# Altium schematic sheet SiPAP_Main_RevC.SchDoc
size 457 x 419 mm; SheetNumber: 1; SheetTotal: 1
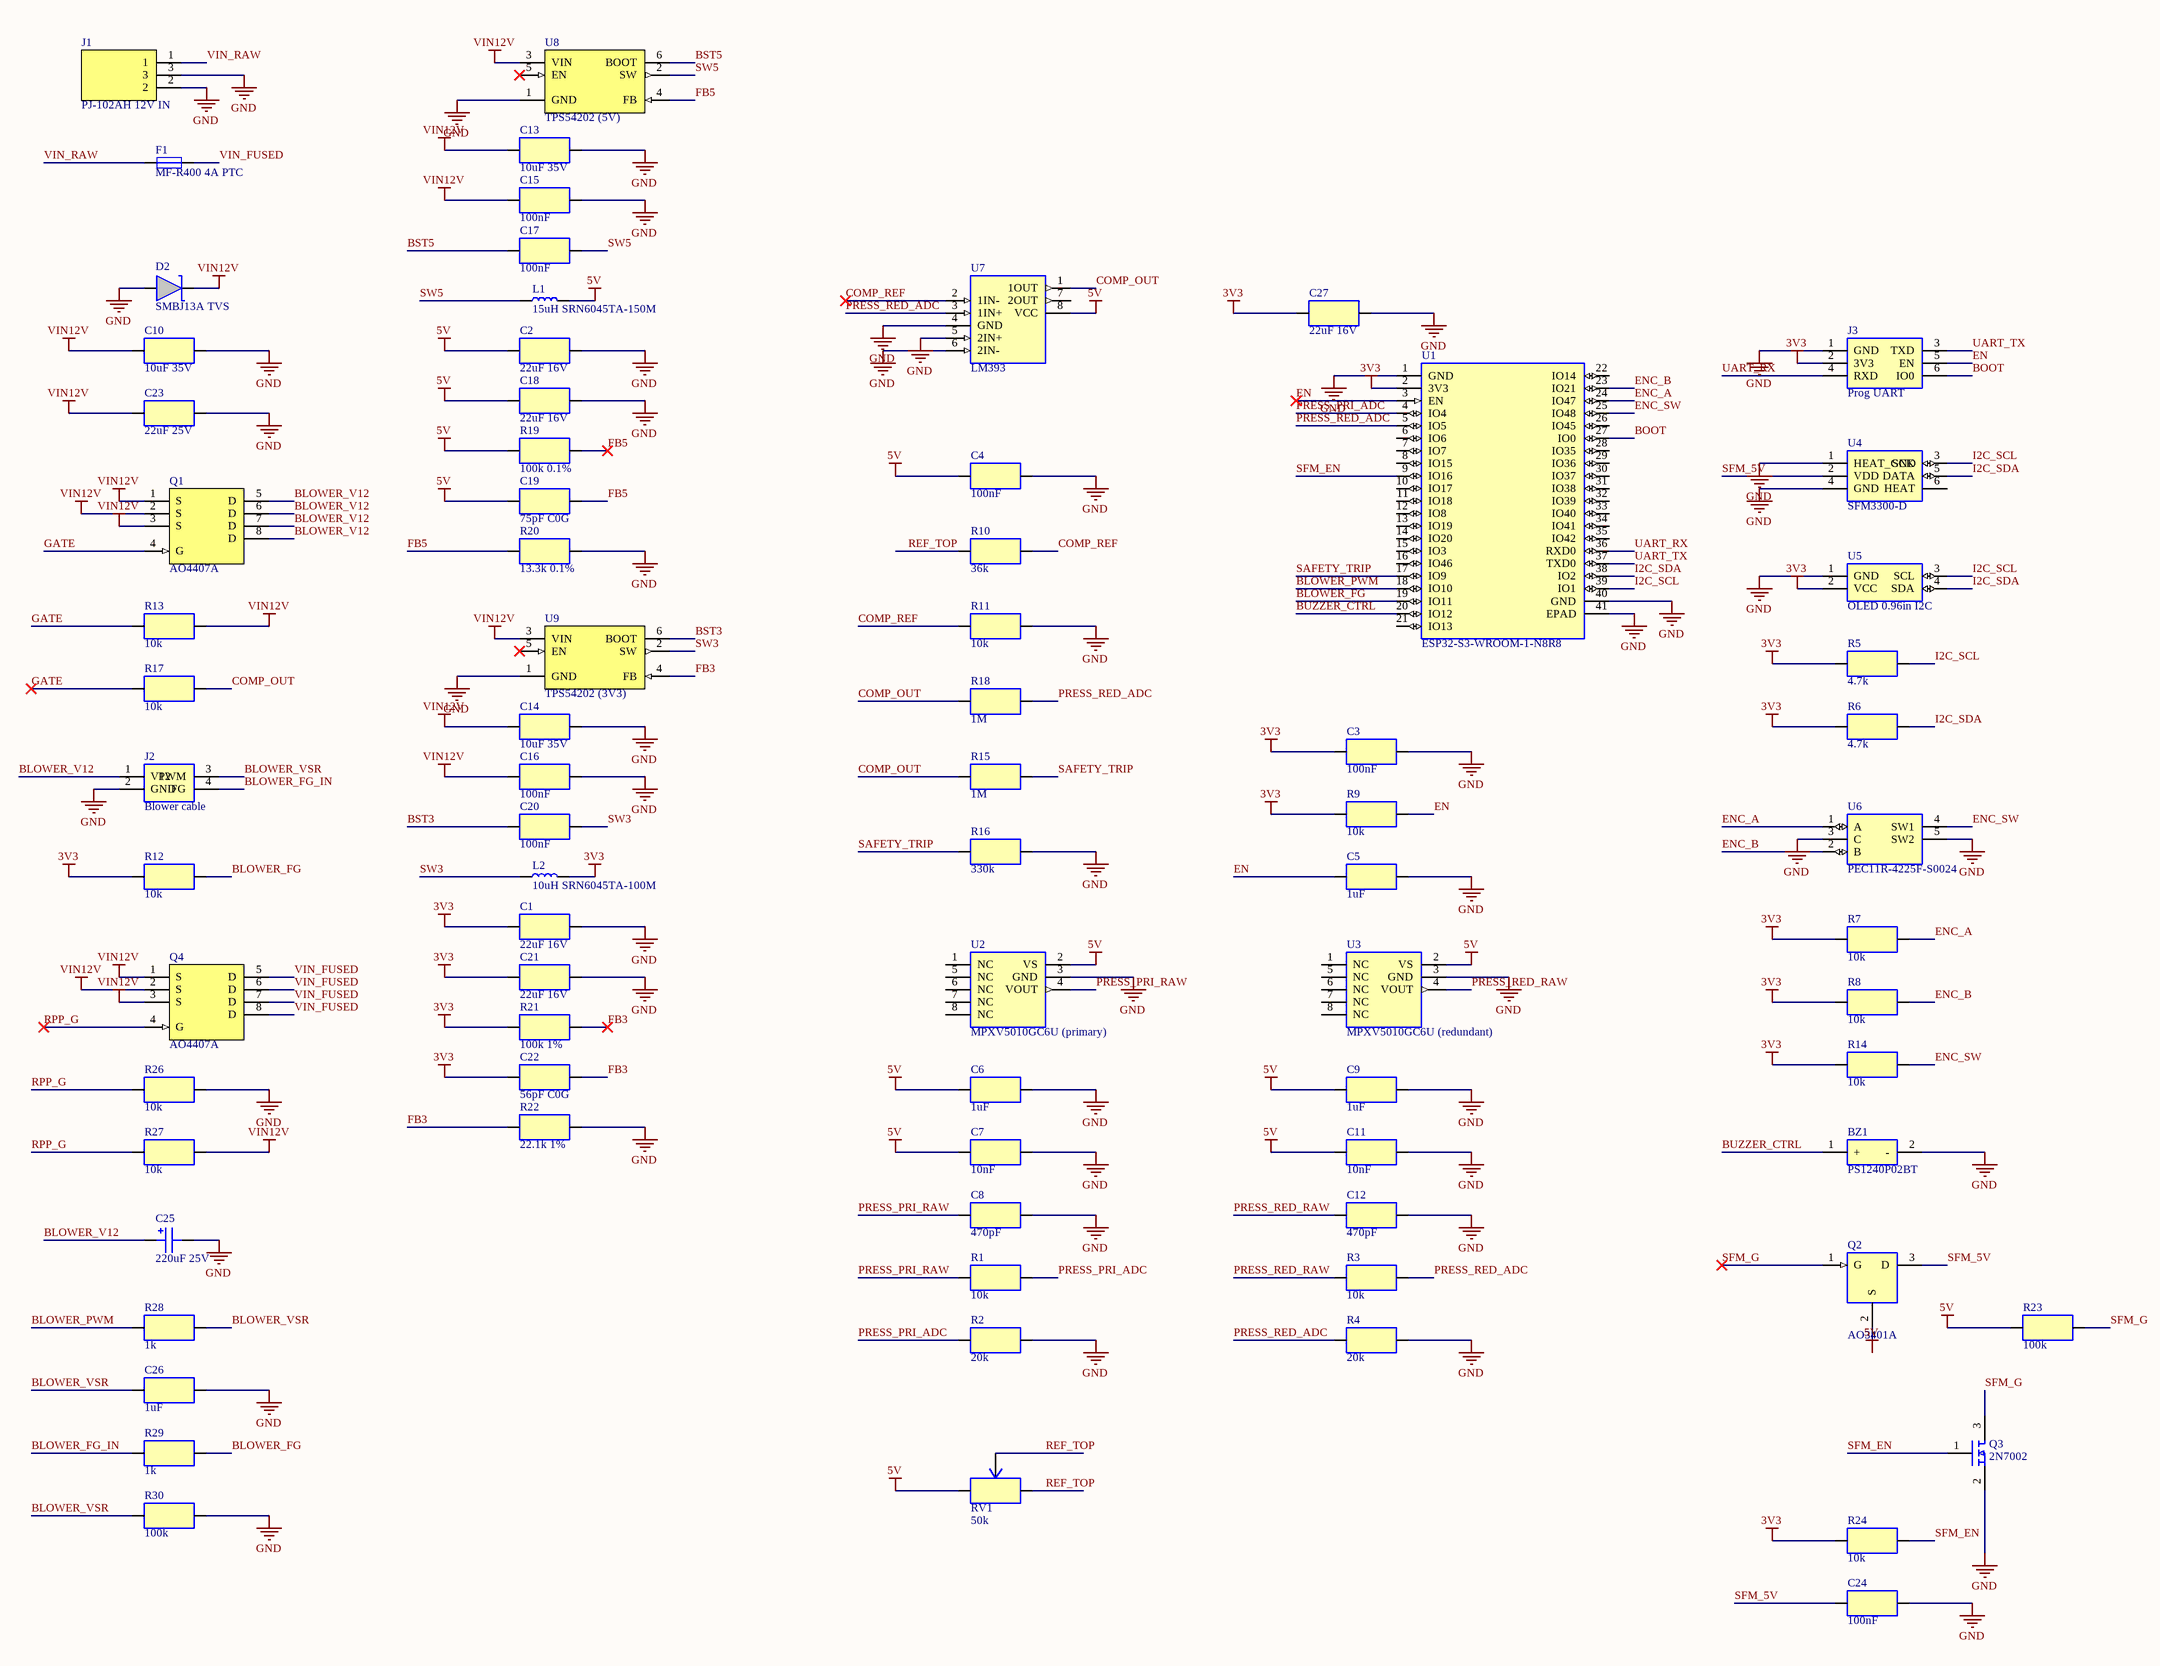
[diagram p0: SiPAP_Main_RevC.SchDoc]

## Parts
BZ1  PS1240P02BT  [BUZZER_TDK_PS1240]
C1  22uF 16V  [R_0805]
C2  22uF 16V  [R_0805]
C3  100nF  [R_0805]
C4  100nF  [R_0805]
C5  1uF  [R_0805]
C6  1uF  [R_0805]
C7  10nF  [R_0805]
C8  470pF  [R_0805]
C9  1uF  [R_0805]
C10  10uF 35V  [R_0805]
C11  10nF  [R_0805]
C12  470pF  [R_0805]
C13  10uF 35V  [R_0805]
C14  10uF 35V  [R_0805]
C15  100nF  [R_0805]
C16  100nF  [R_0805]
C17  100nF  [R_0805]
C18  22uF 16V  [R_0805]
C19  75pF C0G  [R_0805]
C20  100nF  [R_0805]
C21  22uF 16V  [R_0805]
C22  56pF C0G  [R_0805]
C23  22uF 25V  [R_0805]
C24  100nF  [R_0805]
C25  220uF 25V  [CAP_RAD_D8_P3.5]
C26  1uF  [R_0805]
C27  22uF 16V  [R_0805]
D2  SMBJ13A TVS  [DIOM_SMB_DO-214AA_BOURNS]
F1  MF-R400 4A PTC  [PTC_RADIAL_MF-R300]
J1  PJ-102AH 12V IN  [CUI_PJ-102AH]
J2  Blower cable  [CONN_HEADER_4_2X2]
J3  Prog UART  [CONN_HEADER_6]
L1  15uH SRN6045TA-150M  [IND_BOURNS_SRN6045TA]
L2  10uH SRN6045TA-100M  [IND_BOURNS_SRN6045TA]
Q1  AO4407A  [SOIC-8]
Q2  AO3401A  [SOT-23]
Q3  2N7002  [SOT-23]
Q4  AO4407A  [SOIC-8]
R1  10k  [R_0805]
R2  20k  [R_0805]
R3  10k  [R_0805]
R4  20k  [R_0805]
R5  4.7k  [R_0805]
R6  4.7k  [R_0805]
R7  10k  [R_0805]
R8  10k  [R_0805]
R9  10k  [R_0805]
R10  36k  [R_0805]
R11  10k  [R_0805]
R12  10k  [R_0805]
R13  10k  [R_0805]
R14  10k  [R_0805]
R15  1M  [R_0805]
R16  330k  [R_0805]
R17  10k  [R_0805]
R18  1M  [R_0805]
R19  100k 0.1%  [R_0805]
R20  13.3k 0.1%  [R_0805]
R21  100k 1%  [R_0805]
R22  22.1k 1%  [R_0805]
R23  100k  [R_0805]
R24  10k  [R_0805]
R26  10k  [R_0805]
R27  10k  [R_0805]
R28  1k  [R_0805]
R29  1k  [R_0805]
R30  100k  [R_0805]
RV1  50k  [BOURNS_3224W]
U1  ESP32-S3-WROOM-1-N8R8  [ESP32-S3-WROOM-1_DS]
U2  MPXV5010GC6U (primary)  [MPXV5010GC6U_482A]
U3  MPXV5010GC6U (redundant)  [MPXV5010GC6U_482A]
U4  SFM3300-D  [CONN_HEADER_6]
U5  OLED 0.96in I2C  [CONN_HEADER_4]
U6  PEC11R-4225F-S0024  [PEC11R-4xxxF-S_DS]
U7  LM393  [SOIC-8]
U8  TPS54202 (5V)  [TI_DDC0006A_SOT23-6]
U9  TPS54202 (3V3)  [TI_DDC0006A_SOT23-6]

## Nets
3V3: C1.1 C3.1 C21.1 C22.1 C27.1 J3.2(3V3) L2.2 R5.1 R6.1 R7.1 R8.1 R9.1 R12.1 R14.1 R21.1 R24.1 U1.2(3V3) U5.2(VCC)
5V: C2.1 C4.1 C6.1 C7.1 C9.1 C11.1 C18.1 C19.1 L1.2 Q2.2(S) R19.1 R23.1 RV1.1(CCW) U2.2(VS) U3.2(VS) U7.8(VCC)
GND: BZ1.2(-) C1.2 C2.2 C3.2 C4.2 C5.2 C6.2 C7.2 C8.2 C9.2 C10.2 C11.2 C12.2 C13.2 C14.2 C15.2 C16.2 C18.2 C21.2 C23.2 C24.2 C25.2 C26.2 C27.2 D2.2(A) J1.2 J1.3 J2.2(GND) J3.1(GND) Q3.2(S) R2.2 R4.2 R11.2 R16.2 R20.2 R22.2 R26.2 R30.2 U1.1(GND) U1.40(GND) U1.41(EPAD) U2.3(GND) U3.3(GND) U4.1(HEAT_GND) U4.4(GND) U5.1(GND) U6.3(C) U6.5(SW2) U7.4(GND) U7.5(2IN+) U7.6(2IN-) U8.1(GND) U9.1(GND)
VIN12V: C10.1 C13.1 C14.1 C15.1 C16.1 C23.1 D2.1(K) Q1.1(S) Q1.2(S) Q1.3(S) Q4.1(S) Q4.2(S) Q4.3(S) R13.2 R27.2 U8.3(VIN) U9.3(VIN)
BLOWER_FG: R12.2 R29.2 U1.19(IO11)
BLOWER_FG_IN: J2.4(FG) R29.1
BLOWER_PWM: R28.1 U1.18(IO10)
BLOWER_V12: C25.1 J2.1(V12) Q1.5(D) Q1.6(D) Q1.7(D) Q1.8(D)
BLOWER_VSR: C26.1 J2.3(PWM) R28.2 R30.1
BOOT: J3.6(IO0) U1.27(IO0)
BST3: C20.1 U9.6(BOOT)
BST5: C17.1 U8.6(BOOT)
BUZZER_CTRL: BZ1.1(+) U1.20(IO12)
COMP_OUT: R15.1 R17.2 R18.1 U7.1(1OUT)
COMP_REF: R10.2 R11.1 U7.2(1IN-)
EN: C5.1 J3.5(EN) R9.2 U1.3(EN)
ENC_A: R7.2 U1.24(IO47) U6.1(A)
ENC_B: R8.2 U1.23(IO21) U6.2(B)
ENC_SW: R14.2 U1.25(IO48) U6.4(SW1)
FB3: C22.2 R21.2 R22.1 U9.4(FB)
FB5: C19.2 R19.2 R20.1 U8.4(FB)
GATE: Q1.4(G) R13.1 R17.1
I2C_SCL: R5.2 U1.39(IO1) U4.3(SCK) U5.3(SCL)
I2C_SDA: R6.2 U1.38(IO2) U4.5(DATA) U5.4(SDA)
PRESS_PRI_ADC: R1.2 R2.1 U1.4(IO4)
PRESS_PRI_RAW: C8.1 R1.1 U2.4(VOUT)
PRESS_RED_ADC: R3.2 R4.1 R18.2 U1.5(IO5) U7.3(1IN+)
PRESS_RED_RAW: C12.1 R3.1 U3.4(VOUT)
REF_TOP: R10.1 RV1.2(W) RV1.3(CW)
RPP_G: Q4.4(G) R26.1 R27.1
SAFETY_TRIP: R15.2 R16.1 U1.17(IO9)
SFM_5V: C24.1 Q2.3(D) U4.2(VDD)
SFM_EN: Q3.1(G) R24.2 U1.9(IO16)
SFM_G: Q2.1(G) Q3.3(D) R23.2
SW3: C20.2 L2.1 U9.2(SW)
SW5: C17.2 L1.1 U8.2(SW)
UART_RX: J3.4(RXD) U1.36(RXD0)
UART_TX: J3.3(TXD) U1.37(TXD0)
VIN_FUSED: F1.2 Q4.5(D) Q4.6(D) Q4.7(D) Q4.8(D)
VIN_RAW: F1.1 J1.1

Not connected (* = marked no-connect by the designer): U1 6(IO6) 7(IO7) 8(IO15) 10(IO17) 11(IO18) 12(IO8) 13(IO19) 14(IO20) 15(IO3) 16(IO46) 21(IO13) 22(IO14) 26(IO45) 28(IO35) 29(IO36) 30(IO37) 31(IO38) 32(IO39) 33(IO40) 34(IO41) 35(IO42); U2 1(NC) 5(NC) 6(NC) 7(NC) 8(NC); U3 1(NC) 5(NC) 6(NC) 7(NC) 8(NC); U4 6(HEAT); U7 7(2OUT); U8 5(EN)*; U9 5(EN)*

## Library data of the parts
BZ1 = BUZZER: Generic piezo buzzer, 2-pin; Manufacturer: TDK; Manufacturer Part Number: PS1240P02BT; Manufacturer 1: TDK; Manufacturer Part Number 1: PS1240P02BT
C1 C2 C18 C21 = CAPACITOR: Generic capacitor, 2-pin; Manufacturer: Murata; Manufacturer Part Number: GRM21BR61C226ME44; Manufacturer 1: Murata; Manufacturer Part Number 1: GRM21BR61C226ME44
C3 C4 C15-C17 C20 C24 = CAPACITOR: Generic capacitor, 2-pin; Manufacturer: Samsung; Manufacturer Part Number: CL21B104KBCNNNC; Manufacturer 1: Samsung; Manufacturer Part Number 1: CL21B104KBCNNNC
C5 C6 C9 C26 = CAPACITOR: Generic capacitor, 2-pin; Manufacturer: Samsung; Manufacturer Part Number: CL21B105KAFNNNE; Manufacturer 1: Samsung; Manufacturer Part Number 1: CL21B105KAFNNNE
C7 C11 = CAPACITOR: Generic capacitor, 2-pin; Manufacturer: Samsung; Manufacturer Part Number: CL21B103KBANNNC; Manufacturer 1: Samsung; Manufacturer Part Number 1: CL21B103KBANNNC
C8 C12 = CAPACITOR: Generic capacitor, 2-pin; Manufacturer: Samsung; Manufacturer Part Number: CL21C471JBANNNC; Manufacturer 1: Samsung; Manufacturer Part Number 1: CL21C471JBANNNC
C10 C13 C14 = CAPACITOR: Generic capacitor, 2-pin; Manufacturer: Murata; Manufacturer Part Number: GRM21BR6YA106KE43; Manufacturer 1: Murata; Manufacturer Part Number 1: GRM21BR6YA106KE43
C19 = CAPACITOR: Generic capacitor, 2-pin; Manufacturer: Murata; Manufacturer Part Number: GRM2165C1H750JA01; Manufacturer 1: Murata; Manufacturer Part Number 1: GRM2165C1H750JA01
C22 = CAPACITOR: Generic capacitor, 2-pin; Manufacturer: Murata; Manufacturer Part Number: GRM2165C1H560JA01; Manufacturer 1: Murata; Manufacturer Part Number 1: GRM2165C1H560JA01
C23 = CAPACITOR: Generic capacitor, 2-pin; Manufacturer: Murata; Manufacturer Part Number: GRM21BR61E226ME44; Manufacturer 1: Murata; Manufacturer Part Number 1: GRM21BR61E226ME44
C25 = CAP_POL: Polarized capacitor (aluminium electrolytic), pin 1 = +; Manufacturer: Panasonic; Manufacturer Part Number: EEU-FC1E221; Manufacturer 1: Panasonic; Manufacturer Part Number 1: EEU-FC1E221
C27 = CAPACITOR: MLCC 22uF X5R 16V 0805 - U1 3V3 bulk (Espressif WROOM-1 DS v1.8 Fig 9-1 C1); Manufacturer: Murata; Manufacturer Part Number: GRM21BR61C226ME44; Manufacturer 1: Murata; Manufacturer Part Number 1: GRM21BR61C226ME44
D2 = TVS_UNI: Unidirectional TVS (Bourns SMBJ13A, VRWM 13V, Vc 21.5V@10/1000us, 28.0V@8/20us), pin1 = cathode; Manufacturer: Bourns; Manufacturer Part Number: SMBJ13A; Manufacturer 1: Bourns; Manufacturer Part Number 1: SMBJ13A
F1 = FUSE_PTC: Resettable PTC fuse (Bourns MF-R300); Manufacturer: Bourns; Manufacturer Part Number: MF-R400; Manufacturer 1: Bourns; Manufacturer Part Number 1: MF-R400
J1 = CONN_DCJACK3: DC power jack 3-pin (Same Sky PJ-102AH): 1 centre pin (+), 2 sleeve, 3 switch; Manufacturer: Same Sky; Manufacturer Part Number: PJ-102AH; Manufacturer 1: Same Sky; Manufacturer Part Number 1: PJ-102AH
J2 = CONN_BLOWER4: 4-pin blower cable connector: 12V, GND, PWM, FG; Manufacturer: Wurth Elektronik; Manufacturer Part Number: 61300421121; Manufacturer 1: Wurth Elektronik; Manufacturer Part Number 1: 61300421121
J3 = CONN_UART6: 6-pin 2.54mm programming header (USB-UART): GND 3V3 TXD RXD EN IO0; Manufacturer: Wurth Elektronik; Manufacturer Part Number: 61300611121; Manufacturer 1: Wurth Elektronik; Manufacturer Part Number 1: 61300611121
L1 L2 = INDUCTOR: Power inductor (Bourns SRN6045TA); Manufacturer: Bourns; Manufacturer 1: Bourns
  L1: Manufacturer Part Number: SRN6045TA-150M; Manufacturer Part Number 1: SRN6045TA-150M
  L2: Manufacturer Part Number: SRN6045TA-100M; Manufacturer Part Number 1: SRN6045TA-100M
Q1 Q4 = AO4407A: AOS AO4407A P-channel MOSFET -30V -12A, SOIC-8 (S=1,2,3 G=4 D=5-8, datasheet Rev 11.1 p1 top view); Manufacturer: Alpha & Omega Semiconductor; Manufacturer Part Number: AO4407A; Manufacturer 1: Alpha & Omega Semiconductor; Manufacturer Part Number 1: AO4407A
Q2 = AO3401A: Alpha&Omega AO3401A P-channel MOSFET, SOT-23 (AOS datasheet); Manufacturer: Alpha & Omega Semiconductor; Manufacturer Part Number: AO3401A; Manufacturer 1: Alpha & Omega Semiconductor; Manufacturer Part Number 1: AO3401A
Q3 = 2N7002: N-channel MOSFET 60V 0.2A SOT-23 (Diodes 2N7002 DS11303 p1: 1=G 2=S 3=D); Manufacturer: Diodes Incorporated; Manufacturer Part Number: 2N7002-7-F; Manufacturer 1: Diodes Incorporated; Manufacturer Part Number 1: 2N7002-7-F
R1 R3 R7-R9 R11-R14 R17 R24 R26 R27 = RESISTOR: Generic resistor, 2-pin; Manufacturer: Yageo; Manufacturer Part Number: RC0805FR-0710KL; Manufacturer 1: Yageo; Manufacturer Part Number 1: RC0805FR-0710KL
R2 R4 = RESISTOR: Generic resistor, 2-pin; Manufacturer: Yageo; Manufacturer Part Number: RC0805FR-0720KL; Manufacturer 1: Yageo; Manufacturer Part Number 1: RC0805FR-0720KL
R5 R6 = RESISTOR: Generic resistor, 2-pin; Manufacturer: Yageo; Manufacturer Part Number: RC0805FR-074K7L; Manufacturer 1: Yageo; Manufacturer Part Number 1: RC0805FR-074K7L
R10 = RESISTOR: Generic resistor, 2-pin; Manufacturer: Yageo; Manufacturer Part Number: RC0805FR-0747KL; Manufacturer 1: Yageo; Manufacturer Part Number 1: RC0805FR-0747KL
R15 R18 = RESISTOR: Generic resistor, 2-pin; Manufacturer: Yageo; Manufacturer Part Number: RC0805FR-071ML; Manufacturer 1: Yageo; Manufacturer Part Number 1: RC0805FR-071ML
R16 = RESISTOR: Generic resistor, 2-pin; Manufacturer: Yageo; Manufacturer Part Number: RC0805FR-07330KL; Manufacturer 1: Yageo; Manufacturer Part Number 1: RC0805FR-07330KL
R19 R21 R23 = RESISTOR: Generic resistor, 2-pin; Manufacturer: Yageo; Manufacturer Part Number: RC0805FR-07100KL; Manufacturer 1: Yageo; Manufacturer Part Number 1: RC0805FR-07100KL
R20 = RESISTOR: Generic resistor, 2-pin; Manufacturer: Yageo; Manufacturer Part Number: RC0805FR-0713K3L; Manufacturer 1: Yageo; Manufacturer Part Number 1: RC0805FR-0713K3L
R22 = RESISTOR: Generic resistor, 2-pin; Manufacturer: Yageo; Manufacturer Part Number: RC0805FR-0722K1L; Manufacturer 1: Yageo; Manufacturer Part Number 1: RC0805FR-0722K1L
R28 R29 = RESISTOR: Generic resistor, 2-pin; Manufacturer: Yageo; Manufacturer Part Number: RC0805FR-071KL; Manufacturer 1: Yageo; Manufacturer Part Number 1: RC0805FR-071KL
R30 = RESISTOR: Generic resistor, 2-pin
RV1 = TRIMPOT_3224W: Bourns 3224W trimmer, top adjust (Bourns 3224 DS p.1: 1 = CCW end, 2 = wiper, 3 = CW end)
U1 = ESP32-S3-WROOM-1: Espressif ESP32-S3-WROOM-1 WiFi+BLE module, 41 pins (datasheet v1.8); Manufacturer: Espressif; Manufacturer Part Number: ESP32-S3-WROOM-1-N8R8; Manufacturer 1: Espressif; Manufacturer Part Number 1: ESP32-S3-WROOM-1-N8R8
U2 U3 = MPXV5010GC6U: NXP/Motorola MPXV5010GC6U pressure sensor, SOP-8 (Case 482A), 0-10kPa analog output; Manufacturer: NXP; Manufacturer Part Number: MPXV5010GC6U; Manufacturer 1: NXP; Manufacturer Part Number 1: MPXV5010GC6U
U4 = SFM3300-D: Sensirion SFM3300-D digital flow meter, I2C addr 0x40, 6-pad connector (Datasheet D1 v1.4); Manufacturer: Wurth Elektronik; Manufacturer Part Number: 61300611121; Manufacturer 1: Wurth Elektronik; Manufacturer Part Number 1: 61300611121
U5 = SSD1306_OLED_I2C: 0.96in 128x64 I2C OLED module, 4-pin (GND,VCC,SCL,SDA), addr 0x3C; Manufacturer: Wurth Elektronik; Manufacturer Part Number: 61300411121; Manufacturer 1: Wurth Elektronik; Manufacturer Part Number 1: 61300411121
U6 = PEC11R-4220F-S0024: Bourns PEC11R rotary encoder w/ push switch, 5 terminals (Bourns datasheet Rev 04/26); Manufacturer: Bourns; Manufacturer Part Number: PEC11R-4225F-S0024; Manufacturer 1: Bourns; Manufacturer Part Number 1: PEC11R-4225F-S0024
U7 = LM393: Dual comparator, DIP-8/SOIC-8 (TI datasheet SLCS006); Manufacturer: Texas Instruments; Manufacturer Part Number: LM393DR; Manufacturer 1: Texas Instruments; Manufacturer Part Number 1: LM393DR
U8 U9 = TPS54202: TI TPS54202 4.5-28V 2A synchronous buck, SOT-23-6 (DDC); Manufacturer: Texas Instruments; Manufacturer Part Number: TPS54202DDCR; Manufacturer 1: Texas Instruments; Manufacturer Part Number 1: TPS54202DDCR